# Altium schematic sheet power_vsi.SchDoc
size A4; SheetNumber: 3; SheetTotal: 3
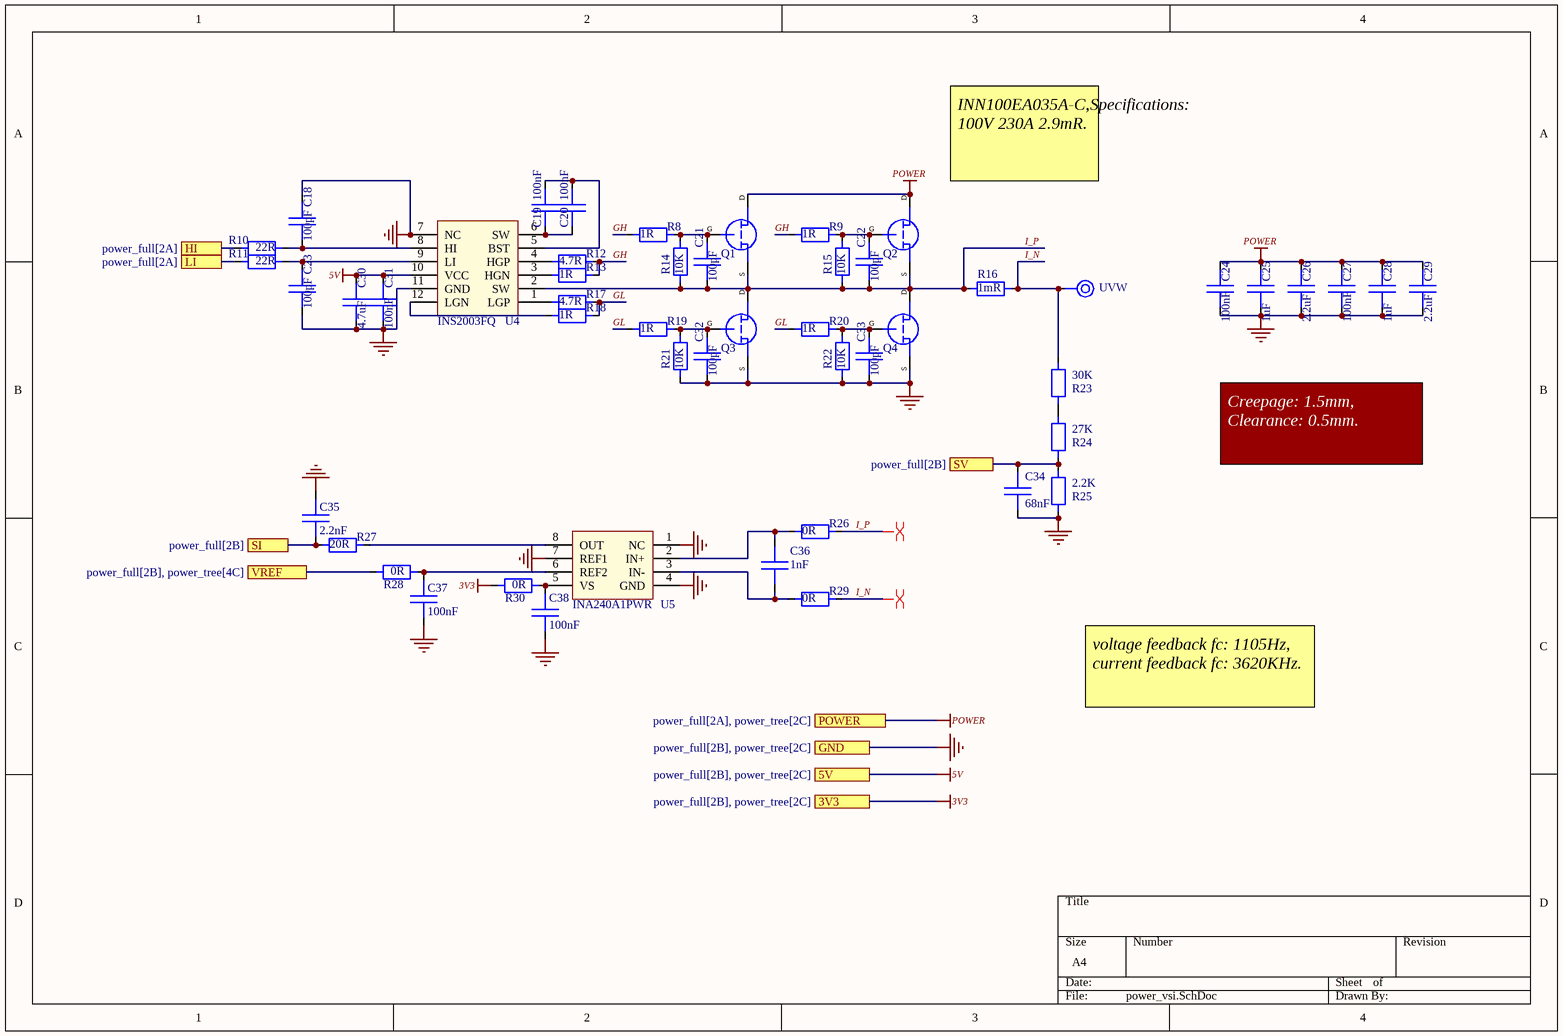
[diagram p0: power_vsi.SchDoc]

## Parts
C18  100pF  [C0402]
C19  100nF  [C0402]
C20  100nF  [C0402]
C21  100pF  [C0402]
C22  100pF  [C0402]
C23  100pF  [C0402]
C24  100nF  [C0805]
C25  1uF  [C0805]
C26  2.2uF  [C0805]
C27  100nF  [C0805]
C28  1uF  [C0805]
C29  2.2uF  [C0805]
C30  4.7uF  [C0402]
C31  100nF  [C0402]
C32  100pF  [C0402]
C33  100pF  [C0402]
C34  68nF  [C0402]
C35  2.2nF  [C0402]
C36  1nF  [C0402]
C37  100nF  [C0402]
C38  100nF  [C0402]
Mp1  UVW  [M2.5-S]
Q1  INN100EA035A  [En-FCLGA9]  (value not drawn)
Q2  INN100EA035A  [En-FCLGA9]  (value not drawn)
Q3  INN100EA035A  [En-FCLGA9]  (value not drawn)
Q4  INN100EA035A  [En-FCLGA9]  (value not drawn)
R8  1R  [R0402]
R9  1R  [R0402]
R10  22R  [R0402]
R11  22R  [R0402]
R12  4.7R  [R0402]
R13  1R  [R0402]
R14  10K  [R0402]
R15  10K  [R0402]
R16  1mR  [R2512]
R17  4.7R  [R0402]
R18  1R  [R0402]
R19  1R  [R0402]
R20  1R  [R0402]
R21  10K  [R0402]
R22  10K  [R0402]
R23  30K  [R0402]
R24  27K  [R0402]
R25  2.2K  [R0402]
R26  0R  [R0402]
R27  20R  [R0402]
R28  0R  [R0402]
R29  0R  [R0402]
R30  0R  [R0402]
U4  INS2003FQ  [QFN12]
U5  INA240A1PWR  [TSSOP8]

## Ports
3V3 (see power_full[2B], power_tree[2C]), 5V (see power_full[2B], power_tree[2C]), GND (see power_full[2B], power_tree[2C]), HI (see power_full[2A]), LI (see power_full[2A]), POWER (see power_full[2A], power_tree[2C]), SI (see power_full[2B]), SV (see power_full[2B]), VREF (see power_full[2B], power_tree[4C])

## Nets
3V3: R30.1 ; port 3V3
5V: C30.2 C31.1 U4.10(VCC) ; port 5V
GND: C18.2 C23.1 C24.1 C25.1 C26.1 C27.1 C28.1 C29.1 C30.1 C31.2 C32.1 C33.1 C34.2 C35.2 C37.1 C38.1 Q3.S Q4.S R21.1 R22.1 R25.2 U4.7(NC) U4.11(GND) U5.1(NC) U5.4(GND) U5.7(REF1) ; port GND
POWER: C24.2 C25.2 C26.2 C27.2 C28.2 C29.2 Q1.D Q2.D ; port POWER
GH: R8.2 R9.2 R12.1 R13.1
GL: R17.1 R18.1 R19.2 R20.2
HI: R10.1 ; port HI
I_N: Mp1.1 R16.1 R23.1 R29.1
I_P: C21.1 C22.1 Q1.S Q2.S Q3.D Q4.D R14.1 R15.1 R16.2 R26.1 U4.2(SW)
LI: R11.1 ; port LI
SI: C35.1 R27.2 ; port SI
SV: C34.1 R24.2 R25.1 ; port SV
VREF: R28.1 ; port VREF
NetC18_1: C18.1 R10.2 U4.8(HI)
NetC19_1: C19.1 C20.1 U4.5(BST)
NetC19_2: C19.2 C20.2 U4.6(SW)
NetC21_2: C21.2 Q1.G R8.1 R14.2
NetC22_2: C22.2 Q2.G R9.1 R15.2
NetC23_2: C23.2 R11.2 U4.9(LI)
NetC32_2: C32.2 Q3.G R19.1 R21.2
NetC33_2: C33.2 Q4.G R20.1 R22.2
NetC36_1: C36.1 R26.2 U5.2(IN+)
NetC36_2: C36.2 R29.2 U5.3(IN-)
NetC37_2: C37.2 R28.2 U5.6(REF2)
NetC38_2: C38.2 R30.2 U5.5(VS)
NetR12_2: R12.2 U4.4(HGP)
NetR13_2: R13.2 U4.3(HGN)
NetR17_2: R17.2 U4.1(LGP)
NetR18_2: R18.2 U4.12(LGN)
NetR23_2: R23.2 R24.1
NetR27_1: R27.1 U5.8(OUT)

## Layout directives
differential pair: I_N, I_P

## Notes on the sheet
- (near Q2) INN100EA035A-C,Specifications:  100V 230A 2.9mR.
- Creepage: 1.5mm, Clearance: 0.5mm.
- voltage feedback fc: 1105Hz, current feedback fc: 3620KHz.

## Library data of the parts
C18 C23 C30 C31 C37 C38 = Capacitor: 16V, 10%
C19 C20 = Capacitor: 25V, 5%
C21 C22 C32-C36 = Capacitor: 16V, 5%
C24-C29 = Capacitor: 100V 10%
Mp1 = Mpad
Q1-Q4 = GaN
R8 R9 R12-R15 R17-R22 R27 = Resistance: 5%
R10 R11 = Resistance: 10%
R16 R23-R25 R30 = Resistance: 1%
R26 R28 R29 = Resistance
U4 = INS200xFQ
U5 = INA240AxPWR